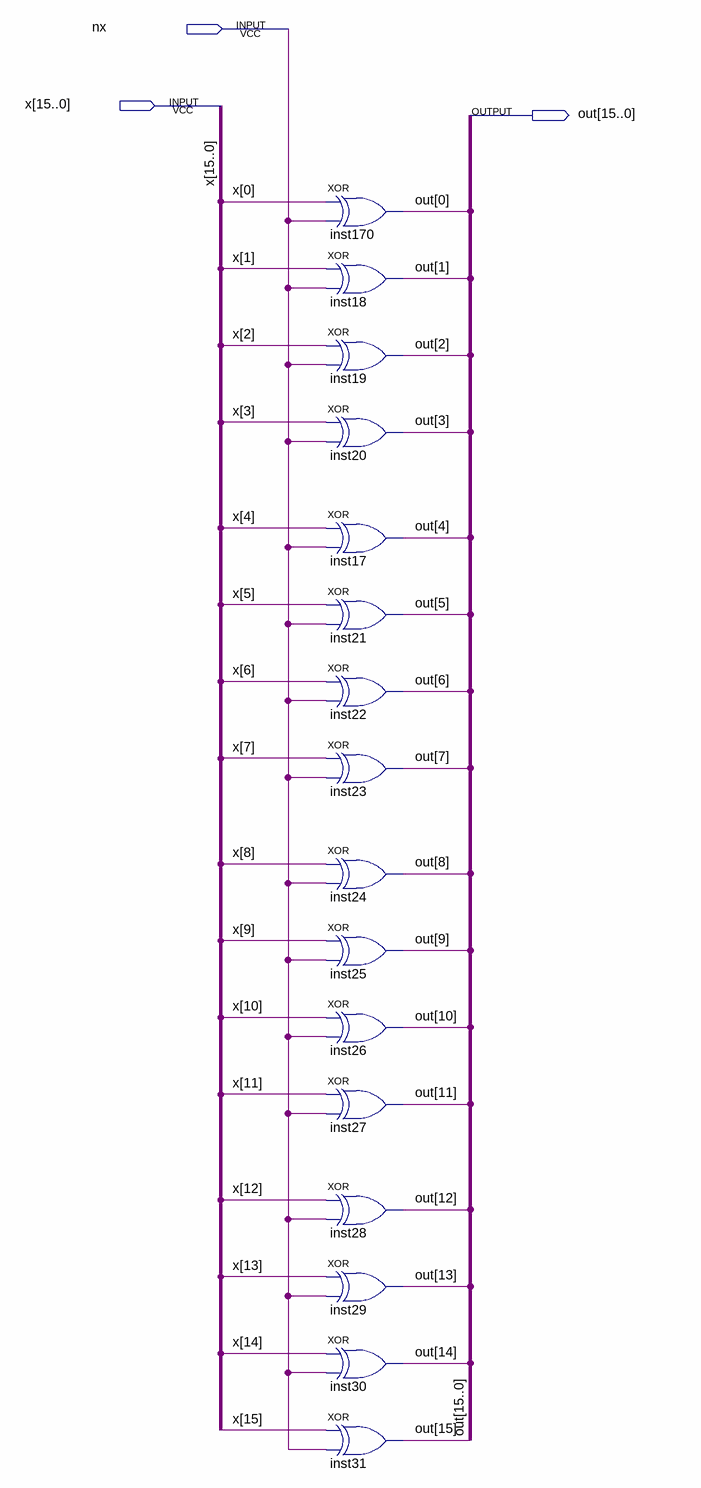
[diagram p0: schematic sheet]
// Quartus schematic bitinversionw16.bdf as structural Verilog: 16 symbols, 3 pins
module bitinversionw16 (
  input  nx,
  input  [15:0] x,
  output [15:0] out
);

  xor inst170 (out[0], x[0], nx);
  xor inst18 (out[1], x[1], nx);
  xor inst19 (out[2], x[2], nx);
  xor inst20 (out[3], x[3], nx);
  xor inst17 (out[4], x[4], nx);
  xor inst21 (out[5], x[5], nx);
  xor inst22 (out[6], x[6], nx);
  xor inst23 (out[7], x[7], nx);
  xor inst24 (out[8], x[8], nx);
  xor inst25 (out[9], x[9], nx);
  xor inst26 (out[10], x[10], nx);
  xor inst27 (out[11], x[11], nx);
  xor inst28 (out[12], x[12], nx);
  xor inst29 (out[13], x[13], nx);
  xor inst30 (out[14], x[14], nx);
  xor inst31 (out[15], x[15], nx);
endmodule
